# Altium project bms-slave-mc33771c-design.PrjPcb
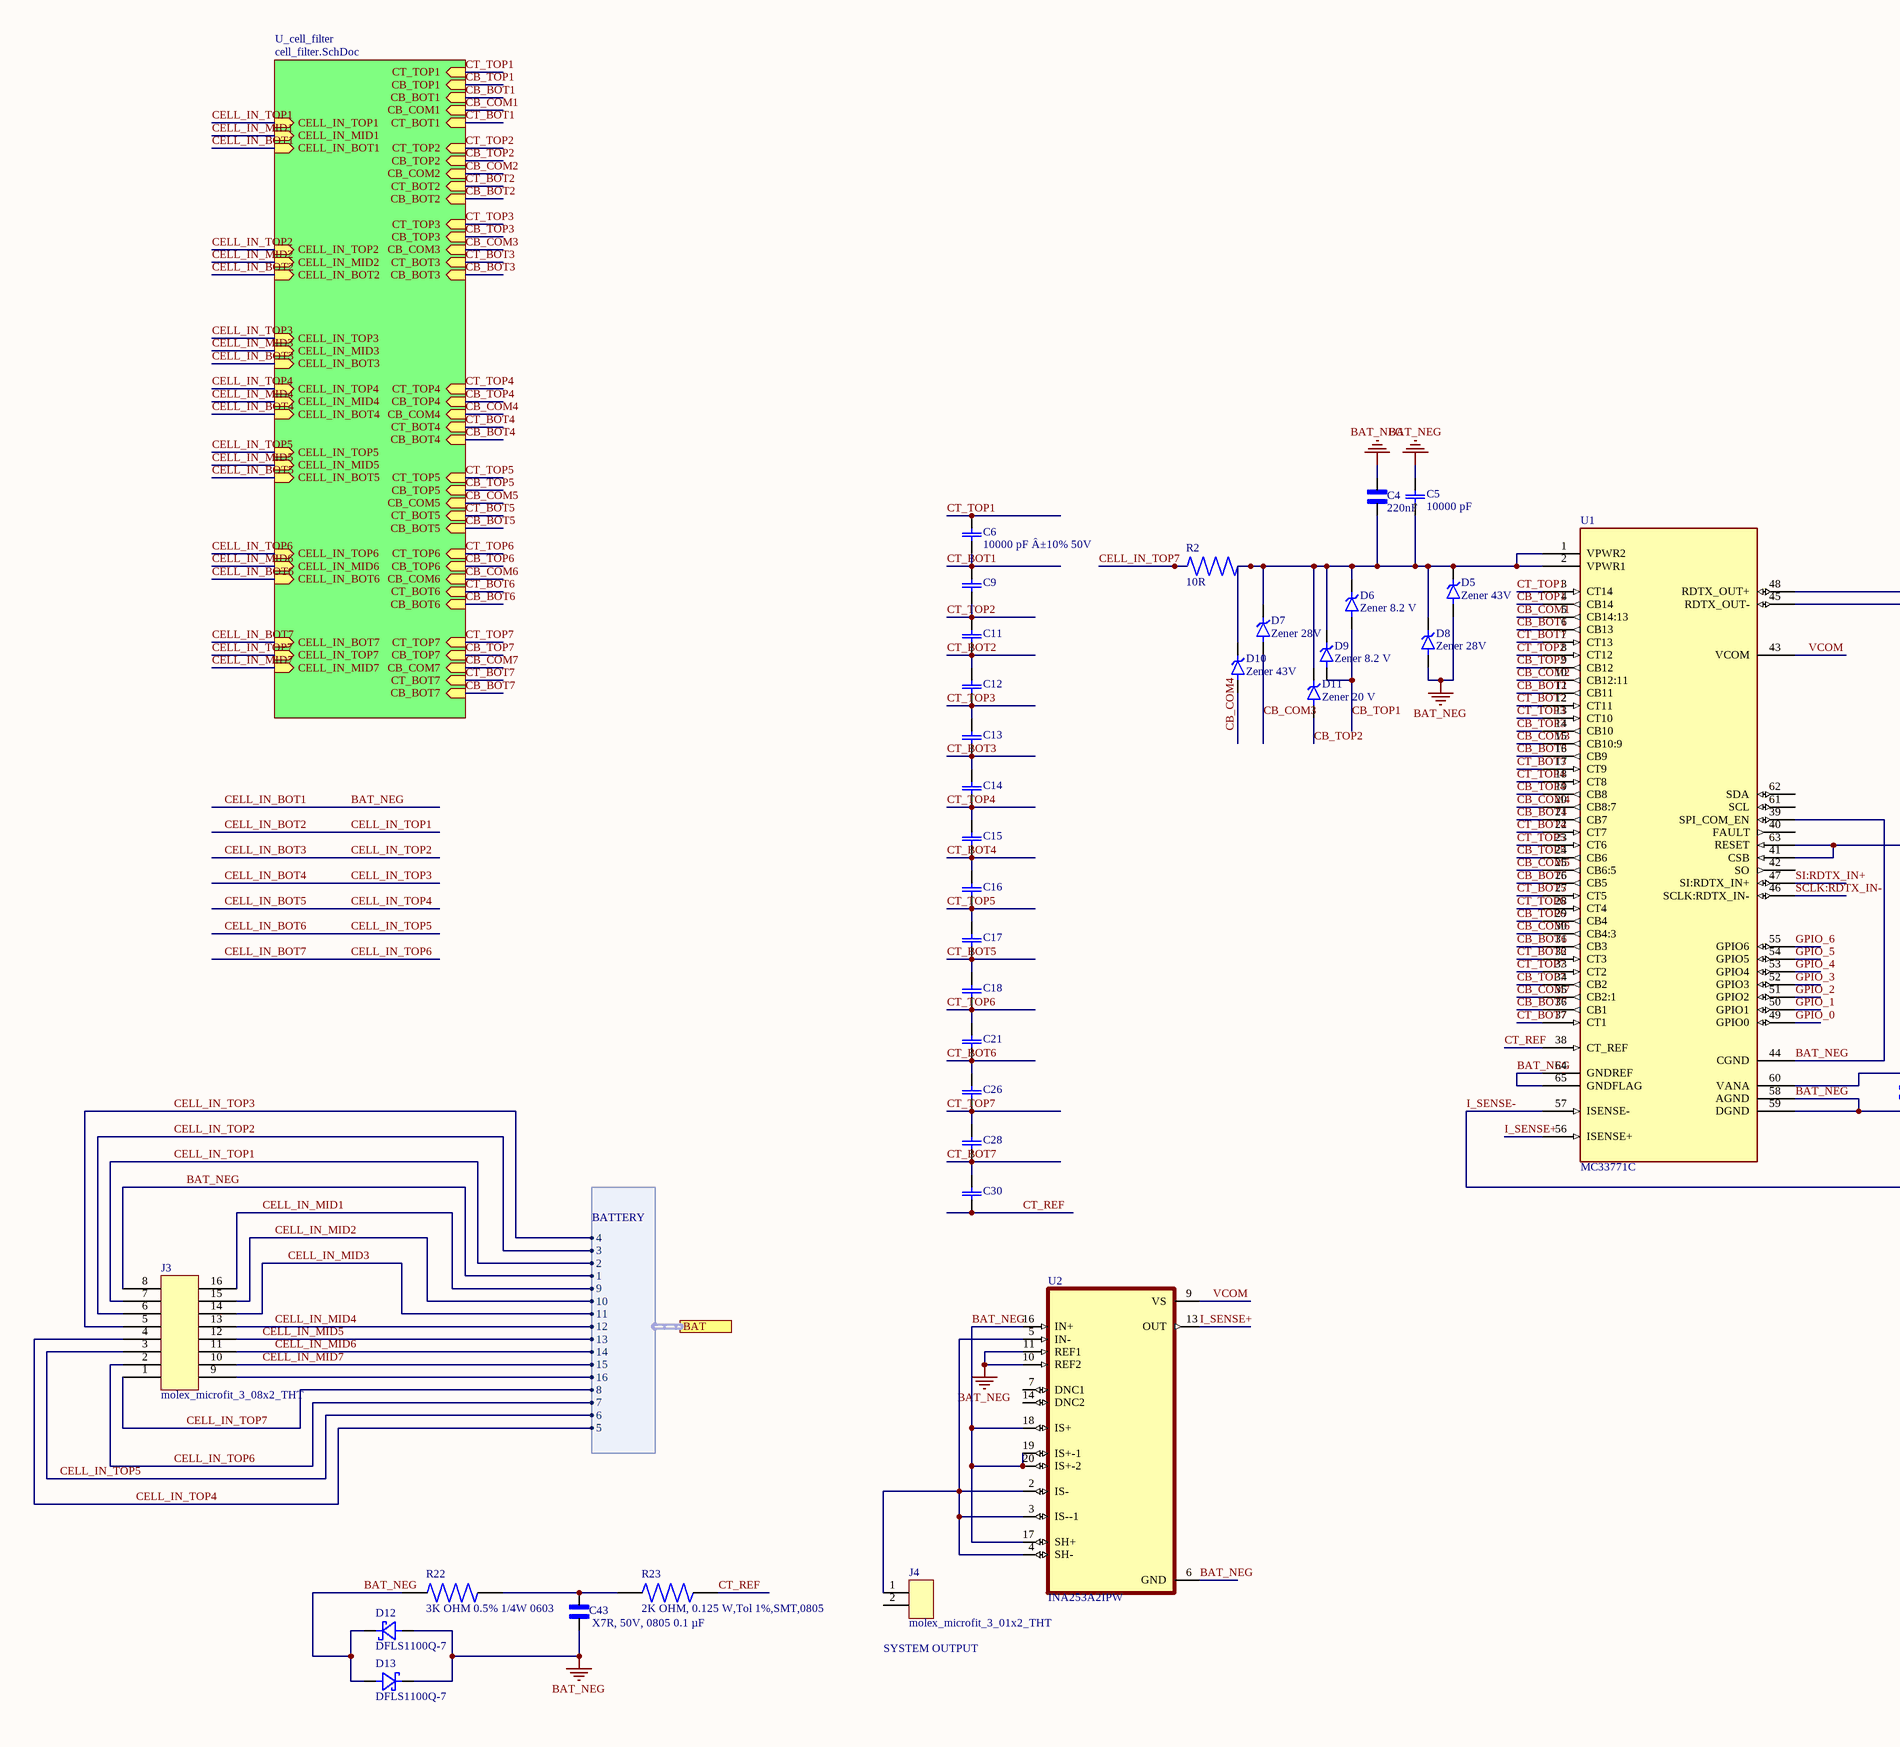
[diagram p0: MC33771C.SchDoc, left]
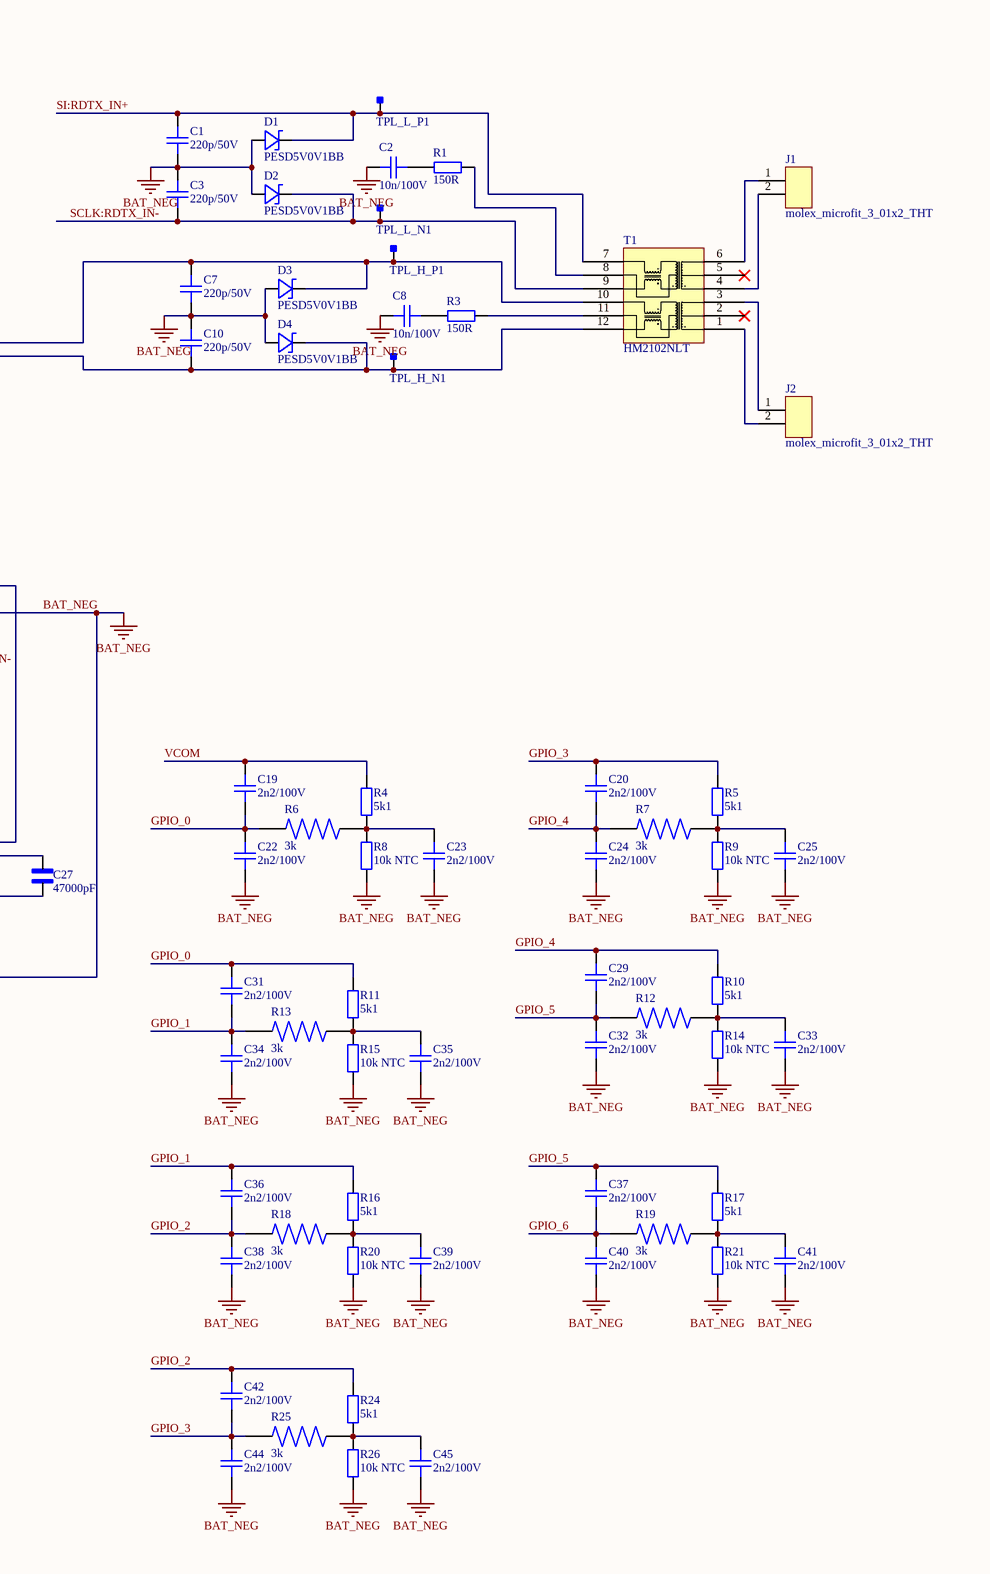
[diagram p1: MC33771C.SchDoc, right]
2 sheets, 221 parts. Net scope: hierarchical (ports join the sheet entries above them; power ports are global).
Board file: PCB1.PcbDoc
Sheets:
  MC33771C.SchDoc
    U_cell_filter = cell_filter.SchDoc

## Sheet MC33771C.SchDoc
size A2

### Parts
C1  220p/50V  [CAPC2012X135N - duplicate1]
C2  10n/100V  [CAPC2012X135N - duplicate1]
C3  220p/50V  [CAPC2012X135N - duplicate1]
C4  220nF  [CAPC2012X135N]
C5  10000 pF  [CAPC2013X110N]
C6  10000 pF Â±10% 50V  [CAPC2013X110N]
C7  220p/50V  [CAPC2012X135N - duplicate1]
C8  10n/100V  [CAPC2012X135N - duplicate1]
C9  CC0805KRX7R9BB103  [CAPC2013X110N]  (value not drawn)
C10  220p/50V  [CAPC2012X135N - duplicate1]
C11  CC0805KRX7R9BB103  [CAPC2013X110N]  (value not drawn)
C12  CC0805KRX7R9BB103  [CAPC2013X110N]  (value not drawn)
C13  CC0805KRX7R9BB103  [CAPC2013X110N]  (value not drawn)
C14  CC0805KRX7R9BB103  [CAPC2013X110N]  (value not drawn)
C15  CC0805KRX7R9BB103  [CAPC2013X110N]  (value not drawn)
C16  CC0805KRX7R9BB103  [CAPC2013X110N]  (value not drawn)
C17  CC0805KRX7R9BB103  [CAPC2013X110N]  (value not drawn)
C18  CC0805KRX7R9BB103  [CAPC2013X110N]  (value not drawn)
C19  2n2/100V  [CAPC2012X135N - duplicate1]
C20  2n2/100V  [CAPC2012X135N - duplicate1]
C21  CC0805KRX7R9BB103  [CAPC2013X110N]  (value not drawn)
C22  2n2/100V  [CAPC2012X135N - duplicate1]
C23  2n2/100V  [CAPC2012X135N - duplicate1]
C24  2n2/100V  [CAPC2012X135N - duplicate1]
C25  2n2/100V  [CAPC2012X135N - duplicate1]
C26  CC0805KRX7R9BB103  [CAPC2013X110N]  (value not drawn)
C27  47000pF  [CAPC2012X135N]
C28  CC0805KRX7R9BB103  [CAPC2013X110N]  (value not drawn)
C29  2n2/100V  [CAPC2012X135N - duplicate1]
C30  CC0805KRX7R9BB103  [CAPC2013X110N]  (value not drawn)
C31  2n2/100V  [CAPC2012X135N - duplicate1]
C32  2n2/100V  [CAPC2012X135N - duplicate1]
C33  2n2/100V  [CAPC2012X135N - duplicate1]
C34  2n2/100V  [CAPC2012X135N - duplicate1]
C35  2n2/100V  [CAPC2012X135N - duplicate1]
C36  2n2/100V  [CAPC2012X135N - duplicate1]
C37  2n2/100V  [CAPC2012X135N - duplicate1]
C38  2n2/100V  [CAPC2012X135N - duplicate1]
C39  2n2/100V  [CAPC2012X135N - duplicate1]
C40  2n2/100V  [CAPC2012X135N - duplicate1]
C41  2n2/100V  [CAPC2012X135N - duplicate1]
C42  2n2/100V  [CAPC2012X135N - duplicate1]
C43  X7R, 50V, 0805 0.1 µF  [CAPC2012X135N]
C44  2n2/100V  [CAPC2012X135N - duplicate1]
C45  2n2/100V  [CAPC2012X135N - duplicate1]
D1  PESD5V0V1BB  [SOD523_PESD_NEXPERIA]
D2  PESD5V0V1BB  [SOD523_PESD_NEXPERIA]
D3  PESD5V0V1BB  [SOD523_PESD_NEXPERIA]
D4  PESD5V0V1BB  [SOD523_PESD_NEXPERIA]
D5  Zener 43V  [DIO_MMSZ5260BT1G]
D6  Zener 8.2 V  [DIO_MMSZ5237BT1G]
D7  Zener 28V  [DIO_MMSZ5255BT1G]
D8  Zener 28V  [DIO_MMSZ5255BT1G]
D9  Zener 8.2 V  [DIO_MMSZ5237BT1G]
D10  Zener 43V  [DIO_MMSZ5260BT1G]
D11  Zener 20 V  [DIO_MMSZ5250BT1G]
D12  DFLS1100Q-7  [PowerDI123]
D13  DFLS1100Q-7  [PowerDI123]
J1  molex_microfit_3_01x2_THT  [MOLEX_MICROFIT_01x2_THT]
J2  molex_microfit_3_01x2_THT  [MOLEX_MICROFIT_01x2_THT]
J3  molex_microfit_3_08x2_THT  [MOLEX_MICROFIT_08x2_THT]
J4  molex_microfit_3_01x2_THT  [MOLEX_MICROFIT_01x2_THT]
R1  150R  [RESC1608X05N]
R2  10R  [RESC2012X05N]
R3  150R  [RESC1608X05N]
R4  5k1  [RESC1608X05N]
R5  5k1  [RESC1608X05N]
R6  3k  [RES_ERJPA3D3001V]
R7  3k  [RES_ERJPA3D3001V]
R8  10k NTC  [RESC1005X04N]
R9  10k NTC  [RESC1005X04N]
R10  5k1  [RESC1608X05N]
R11  5k1  [RESC1608X05N]
R12  3k  [RES_ERJPA3D3001V]
R13  3k  [RES_ERJPA3D3001V]
R14  10k NTC  [RESC1005X04N]
R15  10k NTC  [RESC1005X04N]
R16  5k1  [RESC1608X05N]
R17  5k1  [RESC1608X05N]
R18  3k  [RES_ERJPA3D3001V]
R19  3k  [RES_ERJPA3D3001V]
R20  10k NTC  [RESC1005X04N]
R21  10k NTC  [RESC1005X04N]
R22  3K OHM 0.5% 1/4W 0603  [RES_ERJPA3D3001V]
R23  2K OHM, 0.125 W,Tol 1%,SMT,0805  [RESC2012X50N]
R24  5k1  [RESC1608X05N]
R25  3k  [RES_ERJPA3D3001V]
R26  10k NTC  [RESC1005X04N]
T1  HM2102NLT  [HM2102NL]
TPL_H_N1  Testpoint_Square  [Testpoint_S1]  (value not drawn)  (no BOM)
TPL_H_P1  Testpoint_Square  [Testpoint_S1]  (value not drawn)  (no BOM)
TPL_L_N1  Testpoint_Square  [Testpoint_S1]  (value not drawn)  (no BOM)
TPL_L_P1  Testpoint_Square  [Testpoint_S1]  (value not drawn)  (no BOM)
U1  MC33771C  [QFP50P1200X1200X160-65N]
U2  INA253A2IPW  [SOP65P640X120-20N]

### Sub-sheets
U_cell_filter = cell_filter.SchDoc: CELL_IN_BOT3 (in), CELL_IN_TOP3 (in), CELL_IN_MID3 (in), CELL_IN_BOT1 (in), CELL_IN_TOP1 (in), CELL_IN_MID1 (in), CELL_IN_BOT2 (in), CELL_IN_TOP2 (in), CELL_IN_MID2 (in), CELL_IN_BOT5 (in), CELL_IN_TOP5 (in), CELL_IN_MID5 (in), CELL_IN_BOT6 (in), CELL_IN_TOP6 (in), CELL_IN_MID6 (in), CELL_IN_BOT7 (in), CELL_IN_TOP7 (in), CELL_IN_MID7 (in), CELL_IN_BOT4 (in), CELL_IN_TOP4 (in), CELL_IN_MID4 (in), CB_COM5 (in), CB_TOP6 (in), CB_TOP7 (in), CT_TOP2 (in), CT_BOT4 (in), CT_BOT5 (in), CB_TOP2 (in), CB_BOT3 (in), CB_BOT4 (in), CB_TOP5 (in), CT_TOP5 (in), CT_TOP3 (in), CT_TOP6 (in), CB_COM7 (in), CT_BOT7 (in), CB_BOT6 (in), CB_COM4 (in), CB_BOT5 (in), CT_BOT6 (in), CB_COM3 (in), CB_COM6 (in), CT_TOP4 (in), CB_TOP4 (in), CB_BOT7 (in), CT_BOT3 (in), CB_TOP3 (in), CB_COM2 (in), CB_BOT2 (in), CT_BOT2 (in), CT_TOP7 (in), CB_TOP1 (in), CB_BOT1 (in), CB_COM1 (in), CT_BOT1 (in), CT_TOP1 (in)

### Ports
BAT (harness BATTERY)

### Harnesses
BATTERY: 5, 6, 7, 8, 9, 10, 11, 12, 13, 14, 15, 4, 3, 2, 1, 16

### Nets
BAT_NEG: C1.1 C2.1 C3.2 C4.2 C5.2(C2) C7.1 C8.1 C10.2 C22.1 C23.1 C24.1 C25.1 C27.2 C32.1 C33.1 C34.1 C35.1 C38.1 C39.1 C40.1 C41.1 C43.1 C44.1 C45.1 D1.2(A) D2.2(A) D3.2(A) D4.2(A) D5.2(A) D8.2(A) D12.1(K) D12.2(A) D13.1(K) D13.2(A) J3.8 R8.1 R9.1 R14.1 R15.1 R20.1 R21.1 R22.1 R26.1 U1.39(SPI_COM_EN) U1.41(CSB) U1.44(CGND) U1.57(ISENSE-) U1.58(AGND) U1.59(DGND) U1.63(RESET) U1.64(GNDREF) U1.65(GNDFLAG) U2.6(GND) U2.10(REF2) U2.11(REF1) U2.16(IN+) U2.17(SH+) U2.18(IS+) U2.19(IS+-1) U2.20(IS+-2) ; sheet U_cell_filter/CELL_IN_BOT1, port BAT.1  [also labelled CELL_IN_BOT1, I_SENSE-]
CB_BOT1: U1.6(CB13) ; sheet U_cell_filter/CB_BOT1
CB_BOT2: U1.11(CB11) ; sheet U_cell_filter/CB_BOT2
CB_BOT3: U1.16(CB9) ; sheet U_cell_filter/CB_BOT3
CB_BOT4: U1.21(CB7) ; sheet U_cell_filter/CB_BOT4
CB_BOT5: U1.26(CB5) ; sheet U_cell_filter/CB_BOT5
CB_BOT6: U1.31(CB3) ; sheet U_cell_filter/CB_BOT6
CB_BOT7: U1.36(CB1) ; sheet U_cell_filter/CB_BOT7
CB_COM1: U1.5(CB14:13) ; sheet U_cell_filter/CB_COM1
CB_COM2: U1.10(CB12:11) ; sheet U_cell_filter/CB_COM2
CB_COM3: D7.2(A) U1.15(CB10:9) ; sheet U_cell_filter/CB_COM3
CB_COM4: D10.2(A) U1.20(CB8:7) ; sheet U_cell_filter/CB_COM4
CB_COM5: U1.25(CB6:5) ; sheet U_cell_filter/CB_COM5
CB_COM6: U1.30(CB4:3) ; sheet U_cell_filter/CB_COM6
CB_COM7: U1.35(CB2:1) ; sheet U_cell_filter/CB_COM7
CB_TOP1: D6.2(A) D9.2(A) U1.4(CB14) ; sheet U_cell_filter/CB_TOP1
CB_TOP2: D11.2(A) U1.9(CB12) ; sheet U_cell_filter/CB_TOP2
CB_TOP3: U1.14(CB10) ; sheet U_cell_filter/CB_TOP3
CB_TOP4: U1.19(CB8) ; sheet U_cell_filter/CB_TOP4
CB_TOP5: U1.24(CB6) ; sheet U_cell_filter/CB_TOP5
CB_TOP6: U1.29(CB4) ; sheet U_cell_filter/CB_TOP6
CB_TOP7: U1.34(CB2) ; sheet U_cell_filter/CB_TOP7
CELL_IN_BOT2: J3.7 ; sheet U_cell_filter/CELL_IN_TOP1, sheet U_cell_filter/CELL_IN_BOT2, port BAT.2  [also labelled CELL_IN_TOP1]
CELL_IN_BOT3: J3.6 ; sheet U_cell_filter/CELL_IN_BOT3, sheet U_cell_filter/CELL_IN_TOP2, port BAT.3  [also labelled CELL_IN_TOP2]
CELL_IN_BOT4: J3.5 ; sheet U_cell_filter/CELL_IN_TOP3, sheet U_cell_filter/CELL_IN_BOT4, port BAT.4  [also labelled CELL_IN_TOP3]
CELL_IN_BOT5: J3.4 ; sheet U_cell_filter/CELL_IN_BOT5, sheet U_cell_filter/CELL_IN_TOP4, port BAT.5  [also labelled CELL_IN_TOP4]
CELL_IN_BOT6: J3.3 ; sheet U_cell_filter/CELL_IN_TOP5, sheet U_cell_filter/CELL_IN_BOT6, port BAT.6  [also labelled CELL_IN_TOP5]
CELL_IN_BOT7: J3.2 ; sheet U_cell_filter/CELL_IN_TOP6, sheet U_cell_filter/CELL_IN_BOT7, port BAT.7  [also labelled CELL_IN_TOP6]
CELL_IN_MID1: J3.16 ; sheet U_cell_filter/CELL_IN_MID1, port BAT.9
CELL_IN_MID2: J3.15 ; sheet U_cell_filter/CELL_IN_MID2, port BAT.10
CELL_IN_MID3: J3.14 ; sheet U_cell_filter/CELL_IN_MID3, port BAT.11
CELL_IN_MID4: J3.13 ; sheet U_cell_filter/CELL_IN_MID4, port BAT.12
CELL_IN_MID5: J3.12 ; sheet U_cell_filter/CELL_IN_MID5, port BAT.13
CELL_IN_MID6: J3.11 ; sheet U_cell_filter/CELL_IN_MID6, port BAT.14
CELL_IN_MID7: J3.10 ; sheet U_cell_filter/CELL_IN_MID7, port BAT.15
CELL_IN_TOP7: J3.1 R2.1 ; sheet U_cell_filter/CELL_IN_TOP7, port BAT.8
CT_BOT1: C6.1(C1) C9.2(C2) U1.7(CT13) ; sheet U_cell_filter/CT_BOT1
CT_BOT2: C11.1(C1) C12.2(C2) U1.12(CT11) ; sheet U_cell_filter/CT_BOT2
CT_BOT3: C13.1(C1) C14.2(C2) U1.17(CT9) ; sheet U_cell_filter/CT_BOT3
CT_BOT4: C15.1(C1) C16.2(C2) U1.22(CT7) ; sheet U_cell_filter/CT_BOT4
CT_BOT5: C17.1(C1) C18.2(C2) U1.27(CT5) ; sheet U_cell_filter/CT_BOT5
CT_BOT6: C21.1(C1) C26.2(C2) U1.32(CT3) ; sheet U_cell_filter/CT_BOT6
CT_BOT7: C28.1(C1) C30.2(C2) U1.37(CT1) ; sheet U_cell_filter/CT_BOT7
CT_REF: C30.1(C1) R23.2 U1.38(CT_REF)
CT_TOP1: C6.2(C2) U1.3(CT14) ; sheet U_cell_filter/CT_TOP1
CT_TOP2: C9.1(C1) C11.2(C2) U1.8(CT12) ; sheet U_cell_filter/CT_TOP2
CT_TOP3: C12.1(C1) C13.2(C2) U1.13(CT10) ; sheet U_cell_filter/CT_TOP3
CT_TOP4: C14.1(C1) C15.2(C2) U1.18(CT8) ; sheet U_cell_filter/CT_TOP4
CT_TOP5: C16.1(C1) C17.2(C2) U1.23(CT6) ; sheet U_cell_filter/CT_TOP5
CT_TOP6: C18.1(C1) C21.2(C2) U1.28(CT4) ; sheet U_cell_filter/CT_TOP6
CT_TOP7: C26.1(C1) C28.2(C2) U1.33(CT2) ; sheet U_cell_filter/CT_TOP7
GPIO_0: C19.1 C22.2 C31.2 R6.1 R11.2 U1.49(GPIO0)
GPIO_1: C31.1 C34.2 C36.2 R13.1 R16.2 U1.50(GPIO1)
GPIO_2: C36.1 C38.2 C42.2 R18.1 R24.2 U1.51(GPIO2)
GPIO_3: C20.2 C42.1 C44.2 R5.2 R25.1 U1.52(GPIO3)
GPIO_4: C20.1 C24.2 C29.2 R7.1 R10.2 U1.53(GPIO4)
GPIO_5: C29.1 C32.2 C37.2 R12.1 R17.2 U1.54(GPIO5)
GPIO_6: C37.1 C40.2 R19.1 U1.55(GPIO6)
I_SENSE+: U1.56(ISENSE+) U2.13(OUT)
SCLK:RDTX_IN-: C3.1 D2.1(C) T1.9 TPL_L_N1.1 U1.46(SCLK:RDTX_IN-)
SI:RDTX_IN+: C1.2 D1.1(C) T1.7 TPL_L_P1.1 U1.47(SI:RDTX_IN+)
VCOM: C19.2 R4.2 U1.43(VCOM) U2.9(VS)
NetC2_2: C2.2 R1.1
NetC4_1: C4.1 C5.1(C1) D5.1(K) D6.1(K) D7.1(K) D8.1(K) D9.1(K) D10.1(K) D11.1(K) R2.2 U1.1(VPWR2) U1.2(VPWR1)
NetC7_2: C7.2 D3.1(C) T1.10 TPL_H_P1.1 U1.48(RDTX_OUT+)
NetC8_2: C8.2 R3.1
NetC10_1: C10.1 D4.1(C) T1.12 TPL_H_N1.1 U1.45(RDTX_OUT-)
NetC23_2: C23.2 R4.1 R6.2 R8.2
NetC25_2: C25.2 R5.1 R7.2 R9.2
NetC27_1: C27.1 U1.60(VANA)
NetC33_2: C33.2 R10.1 R12.2 R14.2
NetC35_2: C35.2 R11.1 R13.2 R15.2
NetC39_2: C39.2 R16.1 R18.2 R20.2
NetC41_2: C41.2 R17.1 R19.2 R21.2
NetC43_2: C43.2 R22.2 R23.1
NetC45_2: C45.2 R24.1 R25.2 R26.2
NetJ1_1: J1.1 T1.6
NetJ1_2: J1.2 T1.4
NetJ2_1: J2.1 T1.3
NetJ2_2: J2.2 T1.1
NetJ3_9: J3.9 ; port BAT.16
NetJ4_1: J4.1 U2.2(IS-) U2.3(IS--1) U2.4(SH-) U2.5(IN-)
NetR1_2: R1.2 T1.8
NetR3_2: R3.2 T1.11

Not connected (* = marked no-connect by the designer): J4 2; T1 2* 5*; U1 40(FAULT) 42(SO) 61(SCL) 62(SDA); U2 7(DNC1) 14(DNC2)

### Notes on the sheet
- (near J4) SYSTEM OUTPUT

### Library data of the parts
C1 C3 C7 C10 = gen_C_ceramic_220p_50V_C0G_0603: MLCC; Capacitance: 220p; Rated Voltage: 50V; Dielectric: C0G; Case EIA: 0603; Case Metric: 1608; Automotive Qualified: True; AEC-Q Norm: AEC-Q200; PnP Package: 0603C; Part Number: gen_C_ceramic_220p_50V_C0G_0603; Supplier 1: Mouser; Supplier Part Number 1: 603-AC603JRNPO9BN221; ECCN: EAR99
C2 C8 = gen_C_ceramic_10n_100V_X7R_0603: MLCC; Capacitance: 10n; Rated Voltage: 100V; Dielectric: X7R; Case EIA: 0603; Case Metric: 1608; PnP Package: 0603C; PnP Value: 10nF/100V/X7R; Automotive Qualified: True; AEC-Q Norm: AEC-Q200; Part Number: gen_C_ceramic_10n_100V_X7R_0603; Supplier 1: Farnell; Supplier Part Number 1: 1301715; Supplier 2: Farnell; Supplier Part Number 2: 2821192; Supplier 3: Farnell; Supplier Part Number 3: 2210878; ECCN: EAR99
C4 = GRM21BR71E225KA73L: SMD Capacitor X7R(EIA) with Capacitance: 2.2uF Tol. 10%. Rated Voltage: 25Vdc; MF: Murata; SnapEDA_Link: https://www.snapeda.com/parts/GRM21BR71E225KA73L/Murata/view-part/?ref=snap; Package: 2012 Murata; Value: *; MP: GRM21BR71E225KA73L; Check_prices: https://www.snapeda.com/parts/GRM21BR71E225KA73L/Murata/view-part/?ref=eda
C5 C6 C9 C11-C18 C21 C26 C28 C30 = CC0805KRX7R9BB103: 10000 pF Â±10% 50V Ceramic Capacitor X7R 0805 (2012 Metric); MF: Yageo; SnapEDA_Link: https://www.snapeda.com/parts/CC0805KRX7R9BB103/Yageo/view-part/?ref=snap; Package: 0805 Yageo; Value: *; MP: CC0805KRX7R9BB103; Check_prices: https://www.snapeda.com/parts/CC0805KRX7R9BB103/Yageo/view-part/?ref=eda
C19 C20 C22-C25 C29 C31-C42 C44 C45 = gen_C_ceramic_2n2_100V_X7R_0402: MLCC; Capacitance: 2n2; Rated Voltage: 100V; Dielectric: X7R; Case EIA: 0402; Case Metric: 1005; Automotive Qualified: True; PnP Package: 0402C; Part Number: gen_C_ceramic_2n2_100V_X7R_0402; Supplier 1: Digikey; Supplier Part Number 1: 490-4911-1-ND
C27 = GRM21BR71H473KA01L: SMD Capacitor X7R(EIA) with Capacitance: 47000pF Tol. 10%. Rated Voltage: 50Vdc; MF: Murata; SnapEDA_Link: https://www.snapeda.com/parts/GRM21BR71H473KA01L/Murata/view-part/?ref=snap; Package: 805-2 Murata; Value: *; MP: GRM21BR71H473KA01L; Check_prices: https://www.snapeda.com/parts/GRM21BR71H473KA01L/Murata/view-part/?ref=eda
C43 = GRM21BR71H104KA01L: Seramik, X7R, 50V, 0805 Kılıf0.1 µF / 100 nF; MF: Murata; SnapEDA_Link: https://www.snapeda.com/parts/GRM21BR71H104KA01L/Murata/view-part/?ref=snap; Package: 805-2 Murata; Value: *; MP: GRM21BR71H104KA01L; Check_prices: https://www.snapeda.com/parts/GRM21BR71H104KA01L/Murata/view-part/?ref=eda
D1-D4 = PESD5V0V1BB: Very low capacitance bidirectional ESD protection diode; Manufacturer: Nexperia; Breakdown Voltage: 6.8V; PnP Package: SOD523; Automotive Qualified: True; AEC-Q Norm: AEC-Q101; Part Number: PESD5V0V1BB; Part Name: PESD5V0V1BB; Operating Temperature: -55°C - +150°C; Continuous Forward Current: *; ComponentLink1Description: Datasheet; ComponentLink1URL: https://assets.nexperia.com/documents/data-sheet/PESD5V0V1BB.pdf; Supplier 1: Mouser; Supplier Part Number 1: 771-PESD5V0V1BB115; Supplier 2: Digikey; Supplier Part Number 2: 1727-5808-1-ND; Supplier 3: Farnell; Supplier Part Number 3: 2069367; ECCN: EAR99
D5 D10 = MMSZ5260BT1G: MMSZ5260BT1G Zener Diode, 43V 5% 0.5 W SMT 2-Pin SOD-123 | ON Semiconductor MMSZ5260BT1G; SnapEDA_Link: https://www.snapeda.com/parts/MMSZ5260BT1G/Onsemi/view-part/?ref=snap; Package: SOD-123-2 ON Semiconductor; Value: *; MF: ON Semiconductor; MP: MMSZ5260BT1G; Check_prices: https://www.snapeda.com/parts/MMSZ5260BT1G/Onsemi/view-part/?ref=eda
D6 D9 = MMSZ5237BT1G: Zener Diode 8.2 V 500 mW Â±5% Surface Mount SOD-123; MF: ON Semiconductor; SnapEDA_Link: https://www.snapeda.com/parts/MMSZ5237BT1G/Onsemi/view-part/?ref=snap; Package: SOD-123-2 ON Semiconductor; Value: *; MP: MMSZ5237BT1G; Check_prices: https://www.snapeda.com/parts/MMSZ5237BT1G/Onsemi/view-part/?ref=eda
D7 D8 = MMSZ5255BT1G: MMSZ5255BT1G Zener Diode, 28V 5% 500 mW SMT 2-Pin SOD-123 | ON Semiconductor MMSZ5255BT1G; SnapEDA_Link: https://www.snapeda.com/parts/MMSZ5255BT1G/Onsemi/view-part/?ref=snap; Package: SOD-123-2 ON Semiconductor; Value: *; MF: ON Semiconductor; MP: MMSZ5255BT1G; Check_prices: https://www.snapeda.com/parts/MMSZ5255BT1G/Onsemi/view-part/?ref=eda
D11 = MMSZ5250BT1G: Zener Diode 20 V 500 mW Â±5% Surface Mount SOD-123; MF: ON Semiconductor; SnapEDA_Link: https://www.snapeda.com/parts/MMSZ5250BT1G/Onsemi/view-part/?ref=snap; Package: SOD-123-2 ON Semiconductor; Value: *; MP: MMSZ5250BT1G; Check_prices: https://www.snapeda.com/parts/MMSZ5250BT1G/Onsemi/view-part/?ref=eda
D12 D13 = DFLS1100Q-7: Schottky Diode; Manufacturer: Diodes Inc.; Breakdown Voltage: 100V; Continuous Forward Current: 1A; Automotive Qualified: True; Part Number: DFLS1100Q-7; Part Name: DFLS1100Q-7; Operating Temperature: −55°C - +175°C; ComponentLink1Description: Datasheet; ComponentLink1URL: https://www.diodes.com/assets/Datasheets/ds30497.pdf; Supplier 1: Mouser; Supplier Part Number 1: 621-DFLS1-100Q-7; Supplier 2: Digikey; Supplier Part Number 2: DFLS1100Q-7DICT-ND; Supplier 3: Farnell; Supplier Part Number 3: 3127293; PnP Package: POWERDI123
J1 J2 J4 = molex_microfit_3_01x2_THT: Micro-Fit 3.0 Right Angle Header, 3.00mm Pitch, Dual Row, 2 Circuits, with Snap-in Plastic Peg PCB Lock, Tin, Glow Wire Capable, Black, 43045-0200; Manufacturer: Molex; Circuits: 2; Rated Voltage: 600V; Rated Current: 8.5A; Automotive Qualified: False; Part Number: molex_microfit_3_01x2_THT; Part Name: MicroFit; Operating Temperature: -40°C - +105°C; Supplier 1: Farnell; Supplier Part Number 1: 1012251; ECCN: EAR99
J3 = molex_microfit_3_08x2_THT: Micro-Fit 3.0 Right Angle Header, 3.00mm Pitch, Dual Row, 16 Circuits, with Snap-in Plastic Peg PCB Lock, Tin, Glow Wire Capable, Black, 43045-1600; Manufacturer: Molex; Circuits: 16; Rated Voltage: 600V; Rated Current: 8.5A; Automotive Qualified: False; Part Number: molex_microfit_3_08x2_THT; Part Name: MicroFit; Operating Temperature: -40°C - +105°C; Supplier 1: Farnell; Supplier Part Number 1: 9961380; ECCN: EAR99
R1 R3 = gen_R_150R_0603: SMD Resistor 150R 0603; Tolerance: 1%; Power: 0.1W; Case EIA: 0603; Case Metric: 1608; Maximum Working Voltage: 75V; PnP Package: 0603R; Automotive Qualified: True; AEC-Q Grade: Grade 0; AEC-Q Norm: AEC-Q200; Part Number: gen_R_150R_0603; Operating Temperature: -55°C - +155°C; Resistance: 150R; Series: E24, E96; PnP Value: 150R; ECCN: EAR99; Supplier 1: Farnell; Supplier Part Number 1: 2303076
R2 = gen_R_10R_0805: SMD Resistor 10R 0805; Tolerance: 1%; Power: 0.125W; Case EIA: 0805; Case Metric: 2012; Maximum Working Voltage: 150V; PnP Package: 0805R; Automotive Qualified: True; AEC-Q Norm: AEC-Q200; AEC-Q Grade: Grade 0; Part Number: gen_R_10R_0805; Operating Temperature: -55°C - +155°C; Resistance: 10R; Series: E24, E96; PnP Value: 10R; Supplier 1: Farnell; Supplier Part Number 1: 1750728; ECCN: EAR99
R4 R5 R10 R11 R16 R17 R24 = gen_R_5k1_0603: SMD Resistor 5k1 0603; Tolerance: 5%; Power: 0.1W; Case EIA: 0603; Case Metric: 1608; Maximum Working Voltage: 75V; PnP Package: 0603R; Automotive Qualified: True; AEC-Q Norm: AEC-Q200; Part Number: gen_R_5k1_0603; Operating Temperature: -55°C - +155°C; Resistance: 5k1; Series: E24; PnP Value: 5k1; Supplier 1: Mouser; Supplier Part Number 1: 667-ERJ-3GEYJ512V; ECCN: EAR99
R6 R7 R12 R13 R18 R19 R22 R25 = ERJPA3D3001V: RES SMD 3K OHM 0.5% 1/4W 0603; MF: Panasonic; SnapEDA_Link: https://www.snapeda.com/parts/ERJPA3D3001V/Panasonic/view-part/?ref=snap; Package: 1608-2 Panasonic; Value: *; MP: ERJPA3D3001V; Check_prices: https://www.snapeda.com/parts/ERJPA3D3001V/Panasonic/view-part/?ref=eda
R8 R9 R14 R15 R20 R21 R26 = gen_R_10k_NTC_0402: SMD Resistor 10k NTC 0402; Power: 0.150W; Case EIA: 0402; Maximum Working Voltage: 50V; Automotive Qualified: True; Part Number: gen_R_10k_NTC_0402; Operating Temperature: -40°C - +150°C; Resistance: 10k NTC; Tolerance: *; Series: NTC; Supplier 1: Farnell; Supplier Part Number 1: 2432559; Supplier 2: Digikey; Supplier Part Number 2: 495-76289-1-ND
R23 = CRCW08052K00FKEA: Resistor,Thick Film,Res 2 Kilohms,Pwr-Rtg 0.125 W,Tol 1%,SMT,0805,Tape & Reel | Vishay Dale CRCW08052K00FKEA; SnapEDA_Link: https://www.snapeda.com/parts/CRCW08052K00FKEA/Vishay+Dale/view-part/?ref=snap; Package: 2012 Vishay; Value: *; MF: Vishay Dale; MP: CRCW08052K00FKEA; Check_prices: https://www.snapeda.com/parts/CRCW08052K00FKEA/Vishay+Dale/view-part/?ref=eda
T1 = HM2102NLT: Pulse HM2102NLT BMS Transformer; Automotive Qualified: True; AEC-Q Norm: AEC-Q200; Part Number: HM2102NLT; Manufacturer: Pulse; Operating Temperature: -40°C - +125°C; ComponentLink1Description: Datasheet; ComponentLink1URL: https://www.mouser.de/datasheet/2/336/HM2102NL-1218600.pdf; ECCN: EAR99; Supplier 1: Mouser; Supplier Part Number 1: 673-HM2102NLT; Supplier 2: Digikey; Supplier Part Number 2: 1840-1034-1-ND
TPL_H_N1 TPL_H_P1 TPL_L_N1 TPL_L_P1 = Testpoint_Square: Testpoint, square; Automotive Qualified: False; Part Number: Testpoint_Square
U1 = MC33771CTP1AE: Battery Battery Cell Controller IC Lithium Ion 64-LQFP (10x10); MF: NXP Semiconductors; SnapEDA_Link: https://www.snapeda.com/parts/MC33771CTP1AE/NXP+Semiconductors/view-part/?ref=snap; Package: None; Value: *; MP: MC33771CTP1AE; Check_prices: https://www.snapeda.com/parts/MC33771CTP1AE/NXP+Semiconductors/view-part/?ref=eda
U2 = INA253A2IPW: Package: None; Price: None; Value: *; MP: INA253A2IPW; Availability: Unavailable

## Sheet cell_filter.SchDoc
size A0
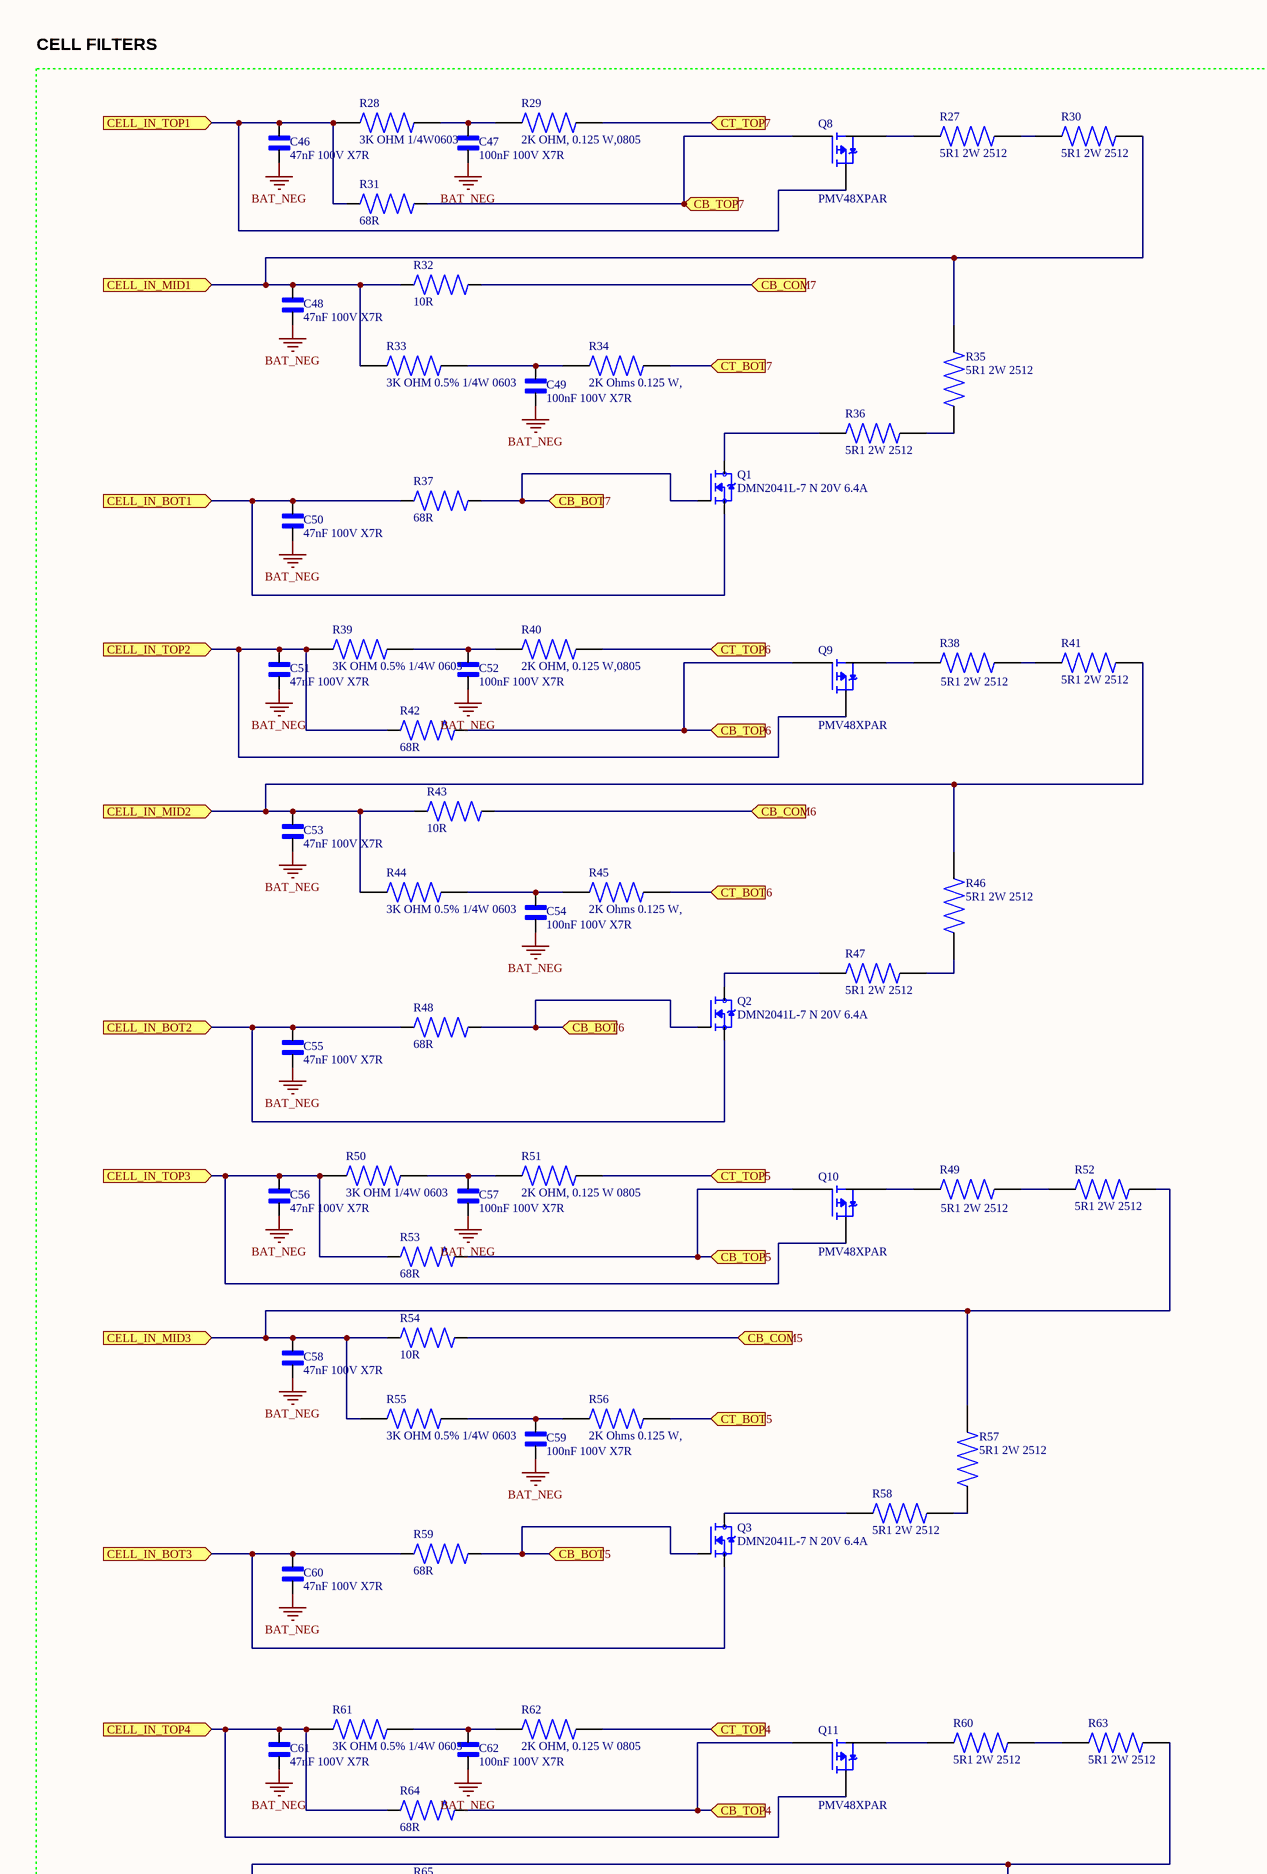
[diagram p2: cell_filter.SchDoc, top]
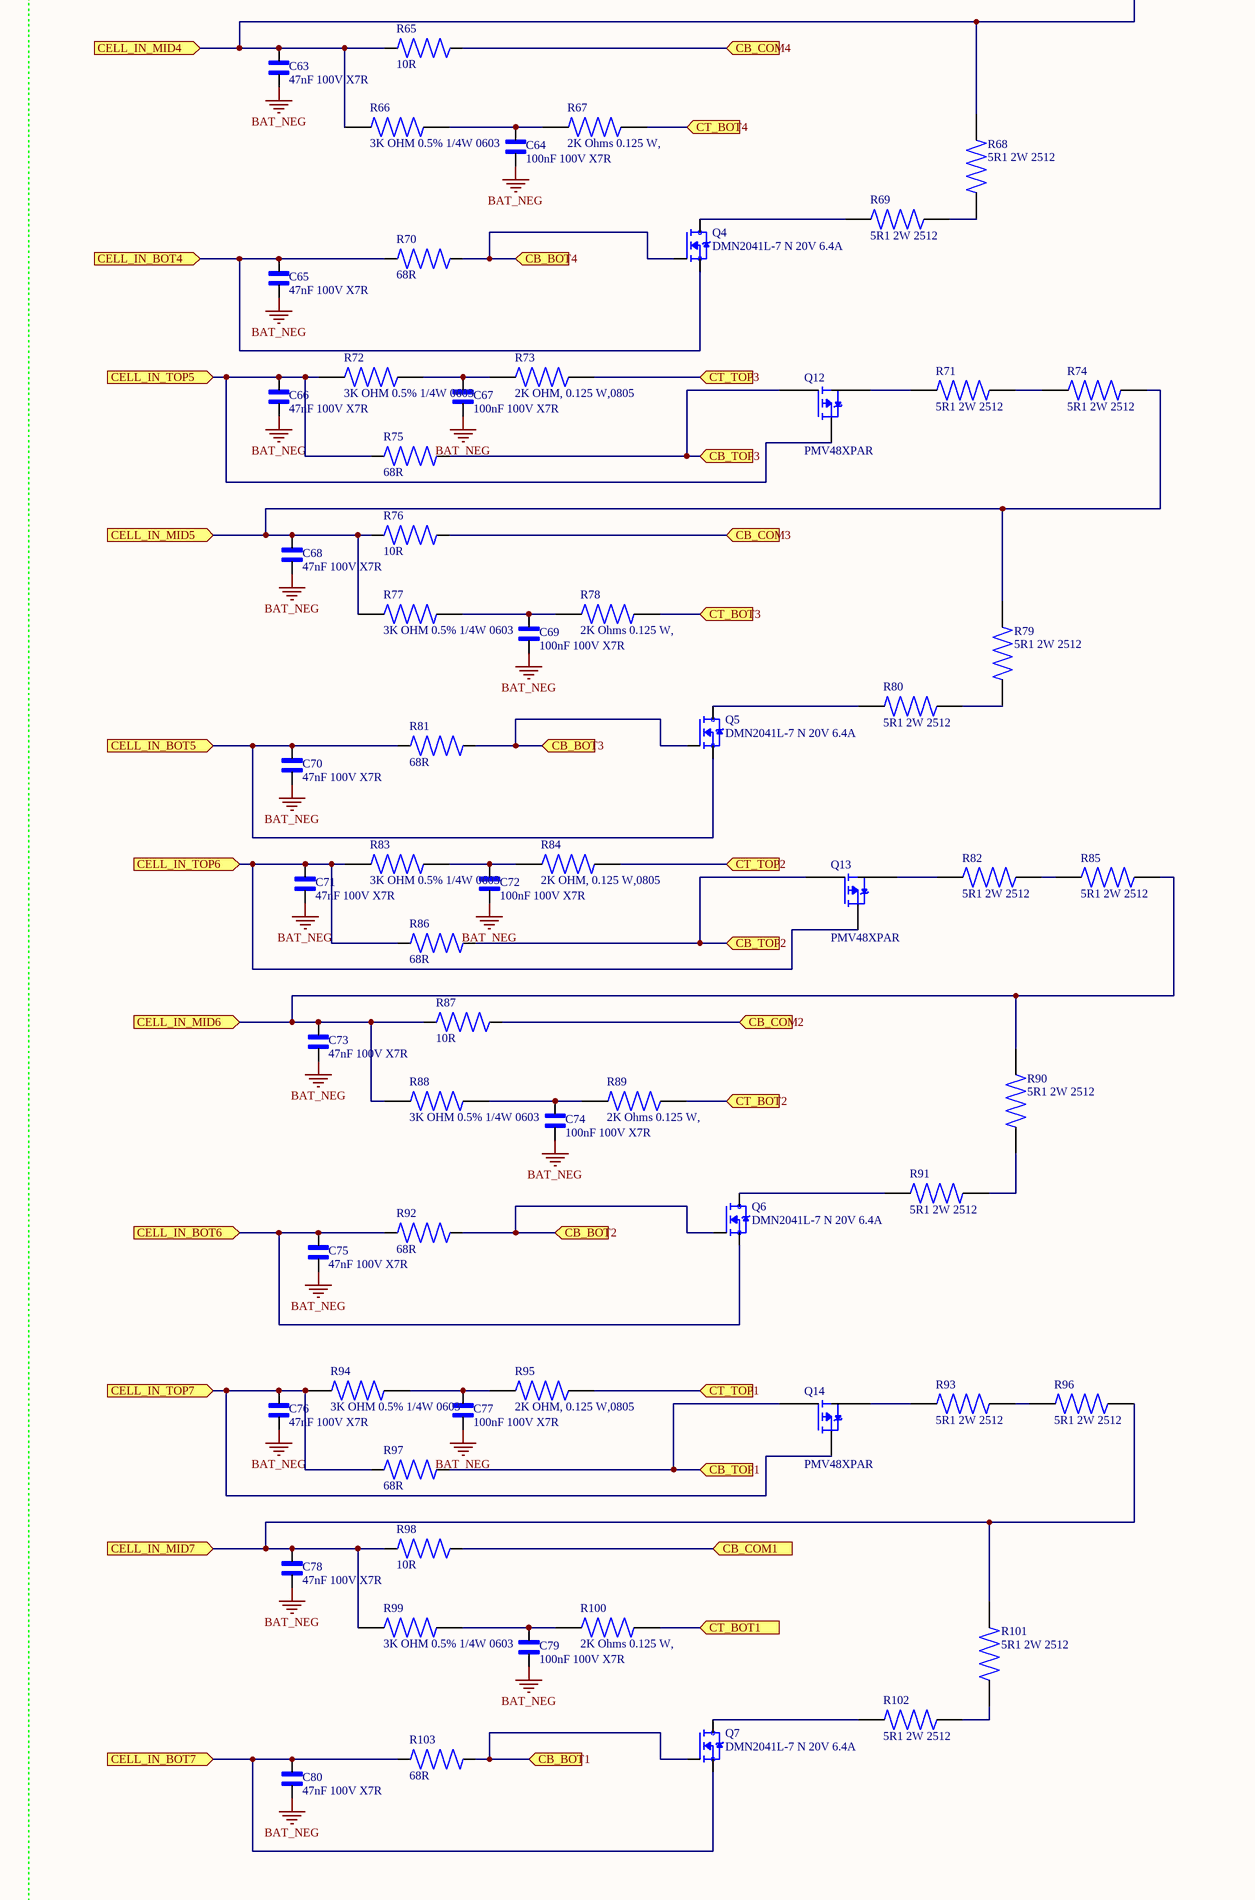
[diagram p3: cell_filter.SchDoc, bottom]

### Parts
C46  47nF 100V X7R  [CAPC2012X135N]
C47  100nF 100V X7R  [CAPC2012X135N]
C48  47nF 100V X7R  [CAPC2012X135N]
C49  100nF 100V X7R  [CAPC2012X135N]
C50  47nF 100V X7R  [CAPC2012X135N]
C51  47nF 100V X7R  [CAPC2012X135N]
C52  100nF 100V X7R  [CAPC2012X135N]
C53  47nF 100V X7R  [CAPC2012X135N]
C54  100nF 100V X7R  [CAPC2012X135N]
C55  47nF 100V X7R  [CAPC2012X135N]
C56  47nF 100V X7R  [CAPC2012X135N]
C57  100nF 100V X7R  [CAPC2012X135N]
C58  47nF 100V X7R  [CAPC2012X135N]
C59  100nF 100V X7R  [CAPC2012X135N]
C60  47nF 100V X7R  [CAPC2012X135N]
C61  47nF 100V X7R  [CAPC2012X135N]
C62  100nF 100V X7R  [CAPC2012X135N]
C63  47nF 100V X7R  [CAPC2012X135N]
C64  100nF 100V X7R  [CAPC2012X135N]
C65  47nF 100V X7R  [CAPC2012X135N]
C66  47nF 100V X7R  [CAPC2012X135N]
C67  100nF 100V X7R  [CAPC2012X135N]
C68  47nF 100V X7R  [CAPC2012X135N]
C69  100nF 100V X7R  [CAPC2012X135N]
C70  47nF 100V X7R  [CAPC2012X135N]
C71  47nF 100V X7R  [CAPC2012X135N]
C72  100nF 100V X7R  [CAPC2012X135N]
C73  47nF 100V X7R  [CAPC2012X135N]
C74  100nF 100V X7R  [CAPC2012X135N]
C75  47nF 100V X7R  [CAPC2012X135N]
C76  47nF 100V X7R  [CAPC2012X135N]
C77  100nF 100V X7R  [CAPC2012X135N]
C78  47nF 100V X7R  [CAPC2012X135N]
C79  100nF 100V X7R  [CAPC2012X135N]
C80  47nF 100V X7R  [CAPC2012X135N]
Q1  DMN2041L-7 N 20V 6.4A  [SOT91P240X110-3N]
Q2  DMN2041L-7 N 20V 6.4A  [SOT91P240X110-3N]
Q3  DMN2041L-7 N 20V 6.4A  [SOT91P240X110-3N]
Q4  DMN2041L-7 N 20V 6.4A  [SOT91P240X110-3N]
Q5  DMN2041L-7 N 20V 6.4A  [SOT91P240X110-3N]
Q6  DMN2041L-7 N 20V 6.4A  [SOT91P240X110-3N]
Q7  DMN2041L-7 N 20V 6.4A  [SOT91P240X110-3N]
Q8  PMV48XPAR  [SOT95P230X110-3N]
Q9  PMV48XPAR  [SOT95P230X110-3N]
Q10  PMV48XPAR  [SOT95P230X110-3N]
Q11  PMV48XPAR  [SOT95P230X110-3N]
Q12  PMV48XPAR  [SOT95P230X110-3N]
Q13  PMV48XPAR  [SOT95P230X110-3N]
Q14  PMV48XPAR  [SOT95P230X110-3N]
R27  5R1 2W 2512  [RESC6331X65N]
R28  3K OHM 1/4W0603  [RES_ERJPA3D3001V]
R29  2K OHM, 0.125 W,0805  [RESC2012X50N]
R30  5R1 2W 2512  [RESC6331X65N]
R31  68R  [RES1206]
R32  10R  [RESC2012X05N]
R33  3K OHM 0.5% 1/4W 0603  [RES_ERJPA3D3001V]
R34  2K Ohms 0.125 W,  [RESC2012X50N]
R35  5R1 2W 2512  [RESC6331X65N]
R36  5R1 2W 2512  [RESC6331X65N]
R37  68R  [RES1206]
R38  5R1 2W 2512  [RESC6331X65N]
R39  3K OHM 0.5% 1/4W 0603  [RES_ERJPA3D3001V]
R40  2K OHM, 0.125 W,0805  [RESC2012X50N]
R41  5R1 2W 2512  [RESC6331X65N]
R42  68R  [RES1206]
R43  10R  [RESC2012X05N]
R44  3K OHM 0.5% 1/4W 0603  [RES_ERJPA3D3001V]
R45  2K Ohms 0.125 W,  [RESC2012X50N]
R46  5R1 2W 2512  [RESC6331X65N]
R47  5R1 2W 2512  [RESC6331X65N]
R48  68R  [RES1206]
R49  5R1 2W 2512  [RESC6331X65N]
R50  3K OHM 1/4W 0603  [RES_ERJPA3D3001V]
R51  2K OHM, 0.125 W 0805  [RESC2012X50N]
R52  5R1 2W 2512  [RESC6331X65N]
R53  68R  [RES1206]
R54  10R  [RESC2012X05N]
R55  3K OHM 0.5% 1/4W 0603  [RES_ERJPA3D3001V]
R56  2K Ohms 0.125 W,  [RESC2012X50N]
R57  5R1 2W 2512  [RESC6331X65N]
R58  5R1 2W 2512  [RESC6331X65N]
R59  68R  [RES1206]
R60  5R1 2W 2512  [RESC6331X65N]
R61  3K OHM 0.5% 1/4W 0603  [RES_ERJPA3D3001V]
R62  2K OHM, 0.125 W 0805  [RESC2012X50N]
R63  5R1 2W 2512  [RESC6331X65N]
R64  68R  [RES1206]
R65  10R  [RESC2012X05N]
R66  3K OHM 0.5% 1/4W 0603  [RES_ERJPA3D3001V]
R67  2K Ohms 0.125 W,  [RESC2012X50N]
R68  5R1 2W 2512  [RESC6331X65N]
R69  5R1 2W 2512  [RESC6331X65N]
R70  68R  [RES1206]
R71  5R1 2W 2512  [RESC6331X65N]
R72  3K OHM 0.5% 1/4W 0603  [RES_ERJPA3D3001V]
R73  2K OHM, 0.125 W,0805  [RESC2012X50N]
R74  5R1 2W 2512  [RESC6331X65N]
R75  68R  [RES1206]
R76  10R  [RESC2012X05N]
R77  3K OHM 0.5% 1/4W 0603  [RES_ERJPA3D3001V]
R78  2K Ohms 0.125 W,  [RESC2012X50N]
R79  5R1 2W 2512  [RESC6331X65N]
R80  5R1 2W 2512  [RESC6331X65N]
R81  68R  [RES1206]
R82  5R1 2W 2512  [RESC6331X65N]
R83  3K OHM 0.5% 1/4W 0603  [RES_ERJPA3D3001V]
R84  2K OHM, 0.125 W,0805  [RESC2012X50N]
R85  5R1 2W 2512  [RESC6331X65N]
R86  68R  [RES1206]
R87  10R  [RESC2012X05N]
R88  3K OHM 0.5% 1/4W 0603  [RES_ERJPA3D3001V]
R89  2K Ohms 0.125 W,  [RESC2012X50N]
R90  5R1 2W 2512  [RESC6331X65N]
R91  5R1 2W 2512  [RESC6331X65N]
R92  68R  [RES1206]
R93  5R1 2W 2512  [RESC6331X65N]
R94  3K OHM 0.5% 1/4W 0603  [RES_ERJPA3D3001V]
R95  2K OHM, 0.125 W,0805  [RESC2012X50N]
R96  5R1 2W 2512  [RESC6331X65N]
R97  68R  [RES1206]
R98  10R  [RESC2012X05N]
R99  3K OHM 0.5% 1/4W 0603  [RES_ERJPA3D3001V]
R100  2K Ohms 0.125 W,  [RESC2012X50N]
R101  5R1 2W 2512  [RESC6331X65N]
R102  5R1 2W 2512  [RESC6331X65N]
R103  68R  [RES1206]

### Blocks framed on the sheet
CELL FILTERS: C46-C80 Q1-Q14 R27-R103

### Ports
CB_BOT1 (in), CB_BOT2 (in), CB_BOT3 (in), CB_BOT4 (in), CB_BOT5 (in), CB_BOT6 (in), CB_BOT7 (in), CB_COM1 (in), CB_COM2 (in), CB_COM3 (in), CB_COM4 (in), CB_COM5 (in), CB_COM6 (in), CB_COM7 (in), CB_TOP1 (in), CB_TOP2 (in), CB_TOP3 (in), CB_TOP4 (in), CB_TOP5 (in), CB_TOP6 (in), CB_TOP7 (in), CELL_IN_BOT1 (in), CELL_IN_BOT2 (in), CELL_IN_BOT3 (in), CELL_IN_BOT4 (in), CELL_IN_BOT5 (in), CELL_IN_BOT6 (in), CELL_IN_BOT7 (in), CELL_IN_MID1 (in), CELL_IN_MID2 (in), CELL_IN_MID3 (in), CELL_IN_MID4 (in), CELL_IN_MID5 (in), CELL_IN_MID6 (in), CELL_IN_MID7 (in), CELL_IN_TOP1 (in), CELL_IN_TOP2 (in), CELL_IN_TOP3 (in), CELL_IN_TOP4 (in), CELL_IN_TOP5 (in), CELL_IN_TOP6 (in), CELL_IN_TOP7 (in), CT_BOT1 (in), CT_BOT2 (in), CT_BOT3 (in), CT_BOT4 (in), CT_BOT5 (in), CT_BOT6 (in), CT_BOT7 (in), CT_TOP1 (in), CT_TOP2 (in), CT_TOP3 (in), CT_TOP4 (in), CT_TOP5 (in), CT_TOP6 (in), CT_TOP7 (in)

### Nets
BAT_NEG: C46.2 C47.1 C48.2 C49.1 C50.1 C50.2 C51.2 C52.1 C53.2 C54.1 C55.2 C56.2 C57.1 C58.2 C59.1 C60.2 C61.2 C62.1 C63.2 C64.1 C65.2 C66.2 C67.1 C68.2 C69.1 C70.2 C71.2 C72.1 C73.2 C74.1 C75.2 C76.2 C77.1 C78.2 C79.1 C80.2 Q1.2(S) R37.1 ; port CELL_IN_BOT1
CB_BOT1: Q7.1(G) R103.2 ; port CB_BOT1
CB_BOT2: Q6.1(G) R92.2 ; port CB_BOT2
CB_BOT3: Q5.1(G) R81.2 ; port CB_BOT3
CB_BOT4: Q4.1(G) R70.2 ; port CB_BOT4
CB_BOT5: Q3.1(G) R59.2 ; port CB_BOT5
CB_BOT6: Q2.1(G) R48.2 ; port CB_BOT6
CB_BOT7: Q1.1(G) R37.2 ; port CB_BOT7
CB_COM1: R98.2 ; port CB_COM1
CB_COM2: R87.2 ; port CB_COM2
CB_COM3: R76.2 ; port CB_COM3
CB_COM4: R65.2 ; port CB_COM4
CB_COM5: R54.2 ; port CB_COM5
CB_COM6: R43.2 ; port CB_COM6
CB_COM7: R32.2 ; port CB_COM7
CB_TOP1: Q14.1(G) R97.2 ; port CB_TOP1
CB_TOP2: Q13.1(G) R86.2 ; port CB_TOP2
CB_TOP3: Q12.1(G) R75.2 ; port CB_TOP3
CB_TOP4: Q11.1(G) R64.2 ; port CB_TOP4
CB_TOP5: Q10.1(G) R53.2 ; port CB_TOP5
CB_TOP6: Q9.1(G) R42.2 ; port CB_TOP6
CB_TOP7: Q8.1(G) R31.2 ; port CB_TOP7
CELL_IN_BOT2: C46.1 C55.1 Q2.2(S) Q8.2(S) R28.1 R31.1 R48.1 ; port CELL_IN_TOP1, port CELL_IN_BOT2
CELL_IN_BOT3: C51.1 C60.1 Q3.2(S) Q9.2(S) R39.1 R42.1 R59.1 ; port CELL_IN_BOT3, port CELL_IN_TOP2
CELL_IN_BOT4: C56.1 C65.1 Q4.2(S) Q10.2(S) R50.1 R53.1 R70.1 ; port CELL_IN_TOP3, port CELL_IN_BOT4
CELL_IN_BOT5: C61.1 C70.1 Q5.2(S) Q11.2(S) R61.1 R64.1 R81.1 ; port CELL_IN_BOT5, port CELL_IN_TOP4
CELL_IN_BOT6: C66.1 C75.1 Q6.2(S) Q12.2(S) R72.1 R75.1 R92.1 ; port CELL_IN_TOP5, port CELL_IN_BOT6
CELL_IN_BOT7: C71.1 C80.1 Q7.2(S) Q13.2(S) R83.1 R86.1 R103.1 ; port CELL_IN_TOP6, port CELL_IN_BOT7
CELL_IN_MID1: C48.1 R30.2 R32.1 R33.1 R35.1 ; port CELL_IN_MID1
CELL_IN_MID2: C53.1 R41.1 R43.1 R44.1 R46.1 ; port CELL_IN_MID2
CELL_IN_MID3: C58.1 R52.1 R54.1 R55.1 R57.1 ; port CELL_IN_MID3
CELL_IN_MID4: C63.1 R63.1 R65.1 R66.1 R68.1 ; port CELL_IN_MID4
CELL_IN_MID5: C68.1 R74.1 R76.1 R77.1 R79.1 ; port CELL_IN_MID5
CELL_IN_MID6: C73.1 R85.1 R87.1 R88.1 R90.1 ; port CELL_IN_MID6
CELL_IN_MID7: C78.1 R96.1 R98.1 R99.1 R101.1 ; port CELL_IN_MID7
CELL_IN_TOP7: C76.1 Q14.2(S) R94.1 R97.1 ; port CELL_IN_TOP7
CT_BOT1: R100.2 ; port CT_BOT1
CT_BOT2: R89.2 ; port CT_BOT2
CT_BOT3: R78.2 ; port CT_BOT3
CT_BOT4: R67.2 ; port CT_BOT4
CT_BOT5: R56.2 ; port CT_BOT5
CT_BOT6: R45.2 ; port CT_BOT6
CT_BOT7: R34.2 ; port CT_BOT7
CT_TOP1: R95.2 ; port CT_TOP1
CT_TOP2: R84.2 ; port CT_TOP2
CT_TOP3: R73.2 ; port CT_TOP3
CT_TOP4: R62.2 ; port CT_TOP4
CT_TOP5: R51.2 ; port CT_TOP5
CT_TOP6: R40.2 ; port CT_TOP6
CT_TOP7: R29.2 ; port CT_TOP7
NetC47_2: C47.2 R28.2 R29.1
NetC49_2: C49.2 R33.2 R34.1
NetC52_2: C52.2 R39.2 R40.1
NetC54_2: C54.2 R44.2 R45.1
NetC57_2: C57.2 R50.2 R51.1
NetC59_2: C59.2 R55.2 R56.1
NetC62_2: C62.2 R61.2 R62.1
NetC64_2: C64.2 R66.2 R67.1
NetC67_2: C67.2 R72.2 R73.1
NetC69_2: C69.2 R77.2 R78.1
NetC72_2: C72.2 R83.2 R84.1
NetC74_2: C74.2 R88.2 R89.1
NetC77_2: C77.2 R94.2 R95.1
NetC79_2: C79.2 R99.2 R100.1
NetQ1_3: Q1.3(D) R36.2
NetQ2_3: Q2.3(D) R47.2
NetQ3_3: Q3.3(D) R58.2
NetQ4_3: Q4.3(D) R69.2
NetQ5_3: Q5.3(D) R80.2
NetQ6_3: Q6.3(D) R91.2
NetQ7_3: Q7.3(D) R102.2
NetQ8_3: Q8.3(D) R27.2
NetQ9_3: Q9.3(D) R38.2
NetQ10_3: Q10.3(D) R49.2
NetQ11_3: Q11.3(D) R60.2
NetQ12_3: Q12.3(D) R71.2
NetQ13_3: Q13.3(D) R82.2
NetQ14_3: Q14.3(D) R93.2
NetR27_1: R27.1 R30.1
NetR35_2: R35.2 R36.1
NetR38_1: R38.1 R41.2
NetR46_2: R46.2 R47.1
NetR49_1: R49.1 R52.2
NetR57_2: R57.2 R58.1
NetR60_1: R60.1 R63.2
NetR68_2: R68.2 R69.1
NetR71_1: R71.1 R74.2
NetR79_2: R79.2 R80.1
NetR82_1: R82.1 R85.2
NetR90_2: R90.2 R91.1
NetR93_1: R93.1 R96.2
NetR101_2: R101.2 R102.1

### Library data of the parts
C46 C48 C50 C51 C53 C55 C56 C58 C60 C61 C63 C65 C66 C68 C70 C71 C73 C75 C76 C78 C80 = GRM21BR71H473KA01L: SMD Capacitor X7R(EIA) with Capacitance: 47000pF Tol. 10%. Rated Voltage: 100Vdc; MF: Yageo; MP: CC0805KKX7R0BB473; Package: yageo; Value: *; Check_prices: https://www.snapeda.com/parts/GRM21BR71H473KA01L/Murata/view-part/?ref=eda
C47 C49 C52 C54 C57 C59 C62 C64 C67 C69 C72 C74 C77 C79 = GRM21BR71H104KA01L: Seramik, X7R, 100V, 0805 Kılıf0.1 µF / 100 nF; MF: Yageo; MP: CC0805KKX7R0BB104; SnapEDA_Link: https://www.snapeda.com/parts/GRM21BR71H104KA01L/Murata/view-part/?ref=snap; Package: 805-2 Murata; Value: *; Check_prices: https://www.snapeda.com/parts/GRM21BR71H104KA01L/Murata/view-part/?ref=eda
Q1-Q7 = DMN2041L-7: MOSFET N-Channel 20V 6.4A SOT23 | Diodes Inc DMN2041L-7; MF: Diodes Inc.; SnapEDA_Link: https://www.snapeda.com/parts/DMN2041L-7/Diodes+Inc./view-part/?ref=snap; Package: SOT-23 Diodes Inc.; Value: *; MP: DMN2041L-7; Check_prices: https://www.snapeda.com/parts/DMN2041L-7/Diodes+Inc./view-part/?ref=eda
Q8-Q14 = PMV48XPAR: P-Channel 20 V 3.5A (Ta) 510mW (Ta), 4.15W (Tc) Surface Mount TO-236AB; MF: Nexperia USA; SnapEDA_Link: https://www.snapeda.com/parts/PMV48XPAR/Nexperia/view-part/?ref=snap; Package: SOT23-3 Nexperia USA Inc.; Value: *; MP: PMV48XPAR; Check_prices: https://www.snapeda.com/parts/PMV48XPAR/Nexperia/view-part/?ref=eda
R27 R30 R35 R36 R38 R41 R46 R47 R49 R52 R57 R58 R60 R63 R68 R69 R71 R74 R79 R80 R82 R85 R90 R91 R93 R96 R101 R102 = SR2512JK-7W10RL: 521 2W 2512; MF: {'manufacturer': u'YAGEO'}; MP: RC2512JK-7W5R1L; Package: None; Price: None; Value: *; Availability: Unavailable
R28 R33 R39 R44 R50 R55 R61 R66 R72 R77 R83 R88 R94 R99 = ERJPA3D3001V: as R6 on sheet MC33771C; SnapEDA_Link: https://www.snapeda.com/parts/ERJPA3D3001V/Panasonic/view-part/?ref=snap; Package: 1608-2 Panasonic; Value: *; MP: ERJPA3D3001V; Check_prices: https://www.snapeda.com/parts/ERJPA3D3001V/Panasonic/view-part/?ref=eda
R29 R34 R40 R45 R51 R56 R62 R67 R73 R78 R84 R89 R95 R100 = CRCW08052K00FKEA: as R23 on sheet MC33771C; SnapEDA_Link: https://www.snapeda.com/parts/CRCW08052K00FKEA/Vishay+Dale/view-part/?ref=snap; Package: 2012 Vishay; Value: *; MF: Vishay Dale; MP: CRCW08052K00FKEA; Check_prices: https://www.snapeda.com/parts/CRCW08052K00FKEA/Vishay+Dale/view-part/?ref=eda
R31 R37 R42 R48 R53 R59 R64 R70 R75 R81 R86 R92 R97 R103 = gen_R_68R_2010: SMD Resistor 68R 1206; Tolerance: 1%; Power: 0.75W; Case EIA: 2010; Case Metric: 5025; Maximum Working Voltage: 200V; PnP Package: 2010R; Automotive Qualified: True; Part Number: gen_R_68R_2010; Operating Temperature: -55°C - +155°C; Resistance: 68R; Series: E24; PnP Value: 68R; Supplier 1: Farnell; Supplier Part Number 1: 2323988
R32 R43 R54 R65 R76 R87 R98 = gen_R_10R_0805: as R2 on sheet MC33771C; Part Number: gen_R_10R_0805; Operating Temperature: -55°C - +155°C; Resistance: 10R; Series: E24, E96; PnP Value: 10R; Supplier 1: Farnell; Supplier Part Number 1: 1750728; ECCN: EAR99

## Nets that join several sheets
BAT_NEG: MC33771C (60 pins), cell_filter (38 pins)
CB_BOT1: MC33771C (U1.6), cell_filter (Q7.1 R103.2)
CB_BOT2: MC33771C (U1.11), cell_filter (Q6.1 R92.2)
CB_BOT3: MC33771C (U1.16), cell_filter (Q5.1 R81.2)
CB_BOT4: MC33771C (U1.21), cell_filter (Q4.1 R70.2)
CB_BOT5: MC33771C (U1.26), cell_filter (Q3.1 R59.2)
CB_BOT6: MC33771C (U1.31), cell_filter (Q2.1 R48.2)
CB_BOT7: MC33771C (U1.36), cell_filter (Q1.1 R37.2)
CB_COM1: MC33771C (U1.5), cell_filter (R98.2)
CB_COM2: MC33771C (U1.10), cell_filter (R87.2)
CB_COM3: MC33771C (D7.2 U1.15), cell_filter (R76.2)
CB_COM4: MC33771C (D10.2 U1.20), cell_filter (R65.2)
CB_COM5: MC33771C (U1.25), cell_filter (R54.2)
CB_COM6: MC33771C (U1.30), cell_filter (R43.2)
CB_COM7: MC33771C (U1.35), cell_filter (R32.2)
CB_TOP1: MC33771C (D6.2 D9.2 U1.4), cell_filter (Q14.1 R97.2)
CB_TOP2: MC33771C (D11.2 U1.9), cell_filter (Q13.1 R86.2)
CB_TOP3: MC33771C (U1.14), cell_filter (Q12.1 R75.2)
CB_TOP4: MC33771C (U1.19), cell_filter (Q11.1 R64.2)
CB_TOP5: MC33771C (U1.24), cell_filter (Q10.1 R53.2)
CB_TOP6: MC33771C (U1.29), cell_filter (Q9.1 R42.2)
CB_TOP7: MC33771C (U1.34), cell_filter (Q8.1 R31.2)
CELL_IN_BOT2: MC33771C (J3.7), cell_filter (7 pins)
CELL_IN_BOT3: MC33771C (J3.6), cell_filter (7 pins)
CELL_IN_BOT4: MC33771C (J3.5), cell_filter (7 pins)
CELL_IN_BOT5: MC33771C (J3.4), cell_filter (7 pins)
CELL_IN_BOT6: MC33771C (J3.3), cell_filter (7 pins)
CELL_IN_BOT7: MC33771C (J3.2), cell_filter (7 pins)
CELL_IN_MID1: MC33771C (J3.16), cell_filter (5 pins)
CELL_IN_MID2: MC33771C (J3.15), cell_filter (5 pins)
CELL_IN_MID3: MC33771C (J3.14), cell_filter (5 pins)
CELL_IN_MID4: MC33771C (J3.13), cell_filter (5 pins)
CELL_IN_MID5: MC33771C (J3.12), cell_filter (5 pins)
CELL_IN_MID6: MC33771C (J3.11), cell_filter (5 pins)
CELL_IN_MID7: MC33771C (J3.10), cell_filter (5 pins)
CELL_IN_TOP7: MC33771C (J3.1 R2.1), cell_filter (C76.1 Q14.2 R94.1 R97.1)
CT_BOT1: MC33771C (C6.1 C9.2 U1.7), cell_filter (R100.2)
CT_BOT2: MC33771C (C11.1 C12.2 U1.12), cell_filter (R89.2)
CT_BOT3: MC33771C (C13.1 C14.2 U1.17), cell_filter (R78.2)
CT_BOT4: MC33771C (C15.1 C16.2 U1.22), cell_filter (R67.2)
CT_BOT5: MC33771C (C17.1 C18.2 U1.27), cell_filter (R56.2)
CT_BOT6: MC33771C (C21.1 C26.2 U1.32), cell_filter (R45.2)
CT_BOT7: MC33771C (C28.1 C30.2 U1.37), cell_filter (R34.2)
CT_TOP1: MC33771C (C6.2 U1.3), cell_filter (R95.2)
CT_TOP2: MC33771C (C9.1 C11.2 U1.8), cell_filter (R84.2)
CT_TOP3: MC33771C (C12.1 C13.2 U1.13), cell_filter (R73.2)
CT_TOP4: MC33771C (C14.1 C15.2 U1.18), cell_filter (R62.2)
CT_TOP5: MC33771C (C16.1 C17.2 U1.23), cell_filter (R51.2)
CT_TOP6: MC33771C (C18.1 C21.2 U1.28), cell_filter (R40.2)
CT_TOP7: MC33771C (C26.1 C28.2 U1.33), cell_filter (R29.2)